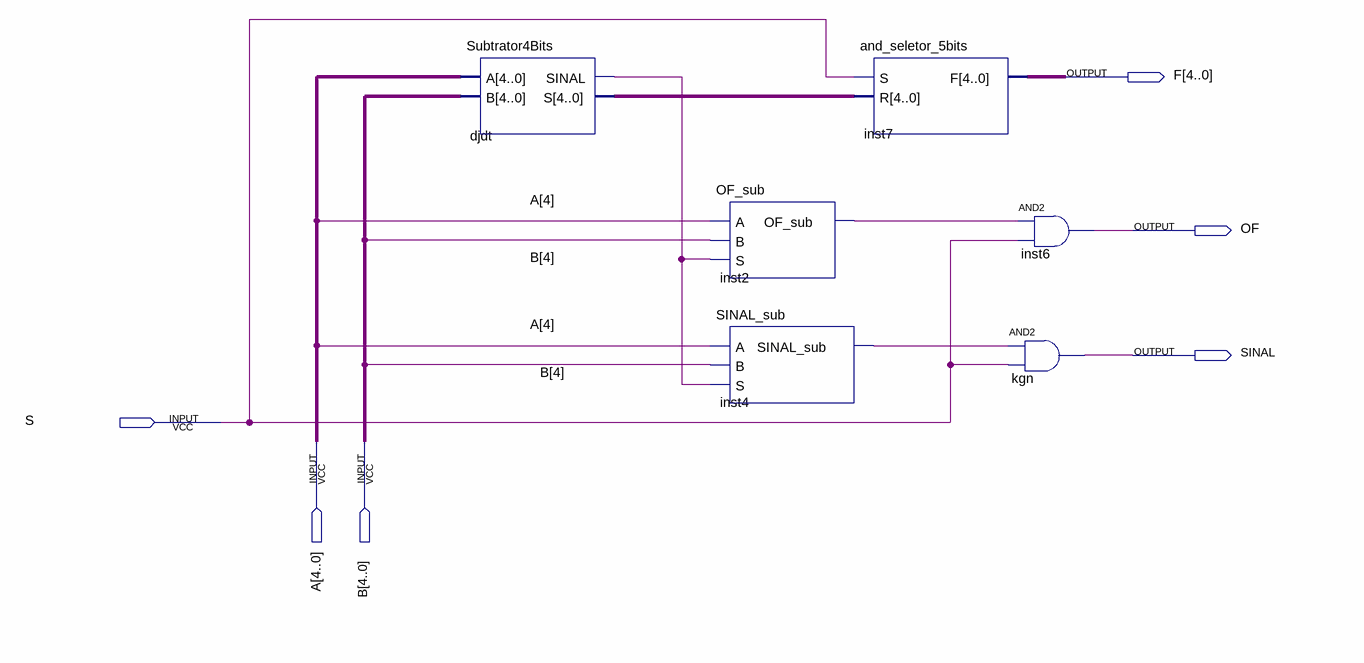
[diagram p0: schematic sheet]
// Quartus schematic bloco_sUB.bdf as structural Verilog: 6 symbols, 6 pins
module bloco_sUB (
  input  S,
  input  [4:0] A,
  input  [4:0] B,
  output [4:0] F,
  output OF,
  output SINAL
);

  wire djdt_sinal, inst2_of_sub, inst4_sinal_sub;
  wire [4:0] djdt_s;

  Subtrator4Bits djdt (.A(A), .B(B), .SINAL(djdt_sinal), .S(djdt_s));
  OF_sub inst2 (.A(A[4]), .B(B[4]), .S(djdt_sinal), .OF_sub(inst2_of_sub));
  SINAL_sub inst4 (.A(A[4]), .B(B[4]), .S(djdt_sinal), .SINAL_sub(inst4_sinal_sub));
  and_seletor_5bits inst7 (.S(S), .R(djdt_s), .F(F));
  and inst6 (OF, inst2_of_sub, S);
  and kgn (SINAL, inst4_sinal_sub, S);
endmodule
